# Altium schematic sheet Buck_Converter.SchDoc
size A4; SheetNumber: 3; SheetTotal: 7
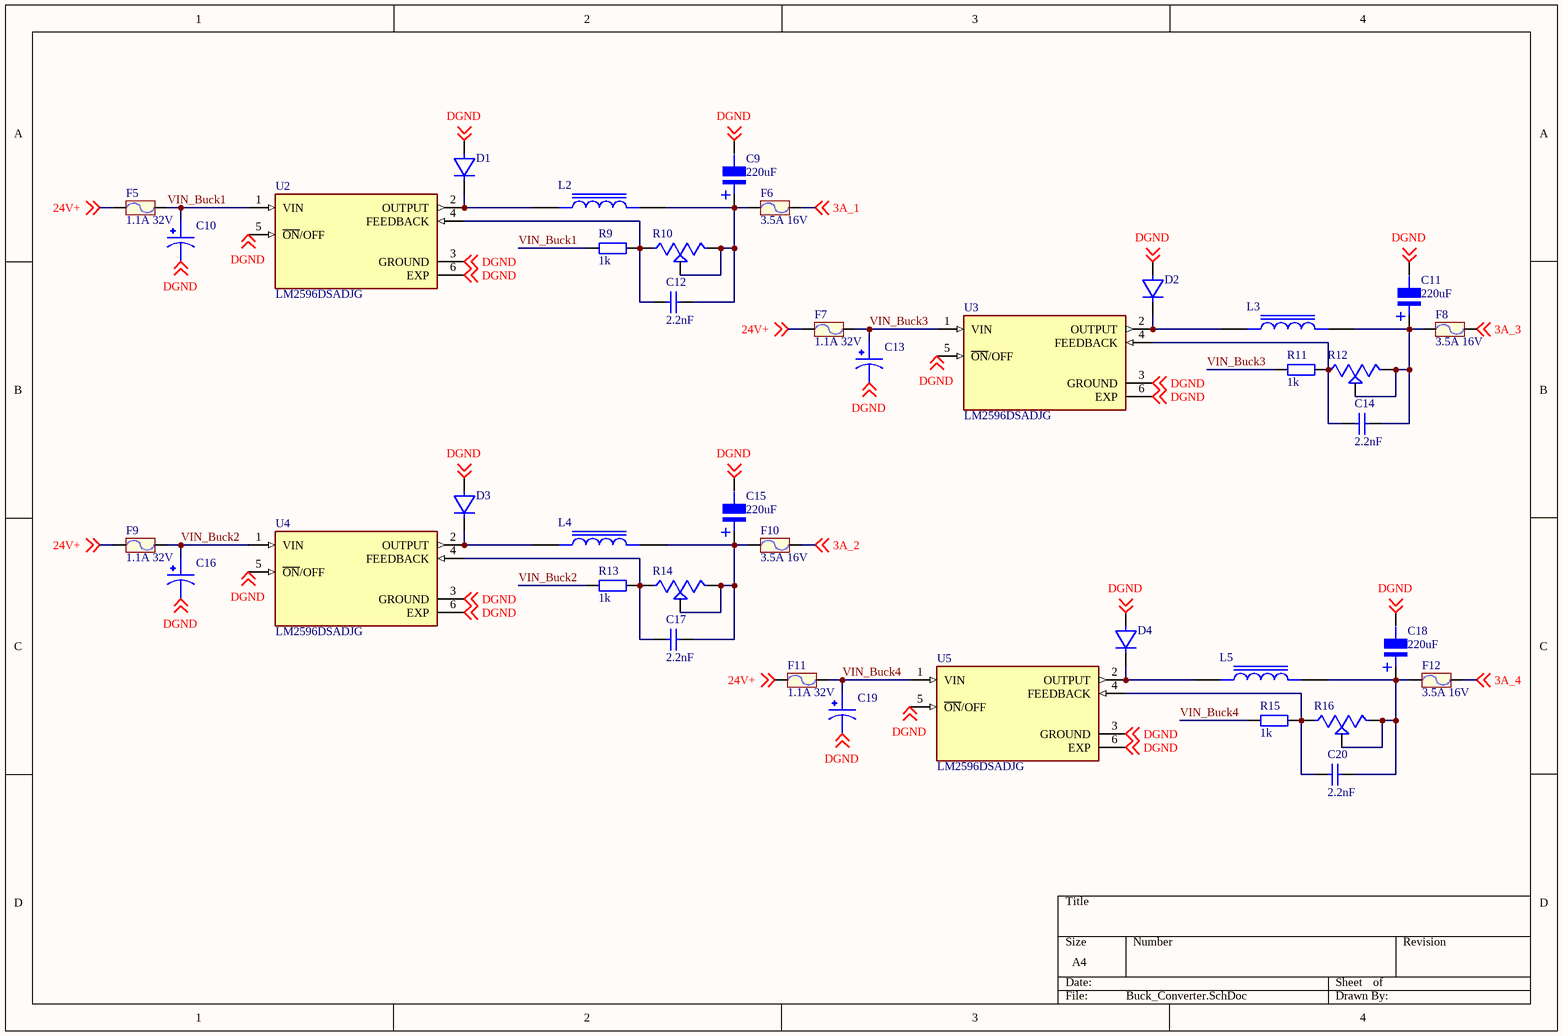
[diagram p0: Buck_Converter.SchDoc]

## Parts
C9  220uF  [tu nhom 8 (f)]
C10  UPW1V471MPD  [CAPPRD500W60D1050H2200]  (value not drawn)
C11  220uF  [tu nhom 8 (f)]
C12  2.2nF  [tu 0805]
C13  UPW1V471MPD  [CAPPRD500W60D1050H2200]  (value not drawn)
C14  2.2nF  [tu 0805]
C15  220uF  [tu nhom 8 (f)]
C16  UPW1V471MPD  [CAPPRD500W60D1050H2200]  (value not drawn)
C17  2.2nF  [tu 0805]
C18  220uF  [tu nhom 8 (f)]
C19  UPW1V471MPD  [CAPPRD500W60D1050H2200]  (value not drawn)
C20  2.2nF  [tu 0805]
D1  SR540  [DO-241]  (value not drawn)
D2  SR540  [DO-241]  (value not drawn)
D3  SR540  [DO-241]  (value not drawn)
D4  SR540  [DO-241]  (value not drawn)
F5  1.1A 32V  [Cau chi tu phuc hoi 2A 24V SMD1812]
F6  3.5A 16V  [Cau chi tu phuc hoi 2A 24V SMD1812]
F7  1.1A 32V  [Cau chi tu phuc hoi 2A 24V SMD1812]
F8  3.5A 16V  [Cau chi tu phuc hoi 2A 24V SMD1812]
F9  1.1A 32V  [Cau chi tu phuc hoi 2A 24V SMD1812]
F10  3.5A 16V  [Cau chi tu phuc hoi 2A 24V SMD1812]
F11  1.1A 32V  [Cau chi tu phuc hoi 2A 24V SMD1812]
F12  3.5A 16V  [Cau chi tu phuc hoi 2A 24V SMD1812]
L2  F1F3-1004T-470M  [IND_F1F3-1004T-470M]  (value not drawn)
L3  F1F3-1004T-470M  [IND_F1F3-1004T-470M]  (value not drawn)
L4  F1F3-1004T-470M  [IND_F1F3-1004T-470M]  (value not drawn)
L5  F1F3-1004T-470M  [IND_F1F3-1004T-470M]  (value not drawn)
R9  1k  [tro smd 0805]
R10  35WR10KLFTR  [TRIM_35WR10KLFTR]  (value not drawn)
R11  1k  [tro smd 0805]
R12  35WR10KLFTR  [TRIM_35WR10KLFTR]  (value not drawn)
R13  1k  [tro smd 0805]
R14  35WR10KLFTR  [TRIM_35WR10KLFTR]  (value not drawn)
R15  1k  [tro smd 0805]
R16  35WR10KLFTR  [TRIM_35WR10KLFTR]  (value not drawn)
U2  LM2596DSADJG  [CONV_LM2596DSADJG]
U3  LM2596DSADJG  [CONV_LM2596DSADJG]
U4  LM2596DSADJG  [CONV_LM2596DSADJG]
U5  LM2596DSADJG  [CONV_LM2596DSADJG]

## Nets
3A_1: F6.2 ; off-sheet 3A_1
3A_2: F10.2 ; off-sheet 3A_2
3A_3: F8.2 ; off-sheet 3A_3
3A_4: F12.2 ; off-sheet 3A_4
24V+: F5.1 F7.1 F9.1 F11.1 ; off-sheet 24V+
DGND: C9.2 C10.2 C11.2 C13.2 C15.2 C16.2 C18.2 C19.2 D1.2(A) D2.2(A) D3.2(A) D4.2(A) U2.3(GROUND) U2.5(~{ON}/OFF) U2.6(EXP) U3.3(GROUND) U3.5(~{ON}/OFF) U3.6(EXP) U4.3(GROUND) U4.5(~{ON}/OFF) U4.6(EXP) U5.3(GROUND) U5.5(~{ON}/OFF) U5.6(EXP) ; off-sheet DGND
VIN_Buck1: C10.1 F5.2 R9.1 U2.1(VIN)
VIN_Buck2: C16.1 F9.2 R13.1 U4.1(VIN)
VIN_Buck3: C13.1 F7.2 R11.1 U3.1(VIN)
VIN_Buck4: C19.1 F11.2 R15.1 U5.1(VIN)
NetC9_1: C9.1 C12.2 F6.1 L2.2 R10.2 R10.3
NetC11_1: C11.1 C14.2 F8.1 L3.2 R12.2 R12.3
NetC12_1: C12.1 R9.2 R10.1 U2.4(FEEDBACK)
NetC14_1: C14.1 R11.2 U3.4(FEEDBACK)
NetC15_1: C15.1 C17.2 F10.1 L4.2 R14.2 R14.3
NetC17_1: C17.1 R13.2 R14.1 U4.4(FEEDBACK)
NetC18_1: C18.1 C20.2 F12.1 L5.2 R16.2 R16.3
NetC20_1: C20.1 R15.2 R16.1 U5.4(FEEDBACK)
NetD1_1: D1.1(K) L2.1 U2.2(OUTPUT)
NetD2_1: D2.1(K) L3.1 U3.2(OUTPUT)
NetD3_1: D3.1(K) L4.1 U4.2(OUTPUT)
NetD4_1: D4.1(K) L5.1 U5.2(OUTPUT)

Not connected (* = marked no-connect by the designer): R12 1

## Notes on the sheet
- (in symbol Tu Nhom 220uF 25V) +

## Library data of the parts
C9 C11 C15 C18 = Tu Nhom 220uF 25V: Dán; Don_Vi: Con; So_Chan: 2; Ten_Linh_Kien: Tụ Nhôm 220uF 25V; Ma_Hang: MH002221; Chung_Loai: Dán; Kieu_Chan: *
C10 C13 C16 C19 = UPW1V471MPD: Capacitor Aluminum Electrolytic, 5000h 10 (Dia.) x 20mm, 470uf 35VDC, PW Series | Nichicon UPW1V471MPD; SnapEDA_Link: https://www.snapeda.com/parts/UPW1V471MPD/Nichicon/view-part/?ref=snap; Package: None; Value: *; MF: Nichicon; MP: UPW1V471MPD; Check_prices: https://www.snapeda.com/parts/UPW1V471MPD/Nichicon/view-part/?ref=eda
C12 C14 C17 C20 = Tu 0805 222 50V 10%: Dán; Don_Vi: Con; So_Chan: 2; Ten_Linh_Kien: Tụ 0805 222-2.2nF 10% 50V; Ma_Hang: MH004557; Chung_Loai: Dán; Kieu_Chan: *
D1-D4 = SR540: Diode Schottky 40V 5A 2-Pin DO-201AD; MF: Rectron; Package: None; Availability: In Stock; Check_prices: https://www.snapeda.com/parts/SR540/Rectron/view-part/?ref=eda; Value: *; MP: SR540; Purchase-URL: https://pricing.snapeda.com/search/part/SR540/?ref=eda; SnapEDA_Link: https://www.snapeda.com/parts/SR540/Rectron/view-part/?ref=snap; Price: None
F5-F12 = Cau chi tu phuc hoi 2A 24V SMD1812: 2A 24V SMD1812; Ma_Hang: MH010033; Ten: Cầu Chì Tự Phục Hồi 2A 24V SMD1812
R9 R11 R13 R15 = Tro 0805 1% 1k: Dán; Don_Vi: Con; So_Chan: 2; Ten_Linh_Kien: Trở 0805 1% 1k; Ma_Hang: MH005468; Chung_Loai: Dán; Kieu_Chan: *
R10 R12 R14 R16 = 35WR10KLFTR: 10 kOhms 0.1W, 1/10W Surface Mount Surface Mount Trimmer Potentiometer Cermet 1.0 Turn Top Adjustment; MF: TT; SnapEDA_Link: https://www.snapeda.com/parts/35WR10KLFTR/TT+Electronics%252FBI/view-part/?ref=snap; Package: FakePackage u; Value: *; MP: 35WR10KLFTR; Check_prices: https://www.snapeda.com/parts/35WR10KLFTR/TT+Electronics%252FBI/view-part/?ref=eda
U2-U5 = LM2596DSADJG: LM2596DSADJG Switching Regulator 3A Adjustable, 1.23 to 37 V, 5-Pin D2PAK | ON Semiconductor LM2596DSADJG; SnapEDA_Link: https://www.snapeda.com/parts/LM2596DSADJG/Onsemi/view-part/?ref=snap; Package: D2PAK-5 ON Semiconductor; Value: *; MF: ON Semiconductor; MP: LM2596DSADJG; Check_prices: https://www.snapeda.com/parts/LM2596DSADJG/Onsemi/view-part/?ref=eda
L2-L5 = F1F3-1004T-470M: Package: None; Price: None; Value: *; MP: F1F3-1004T-470M; Availability: Unavailable